# Altium project pca20072.PrjPCB (part 2 of 2)

## Sheet pca20072_sensors.SchDoc: nRF54L15 Tag - Sensors
size A4; Organization: Nordic Semiconductor; DocumentNumber: 4; Revision: 1.0.0; SheetNumber: 4; SheetTotal: 5; Author: RUBR; CompanyName: Nordic Semiconductor; DrawnBy: RUBR; DocumentSize: A4; ProjectName: nRF54L15-TAG
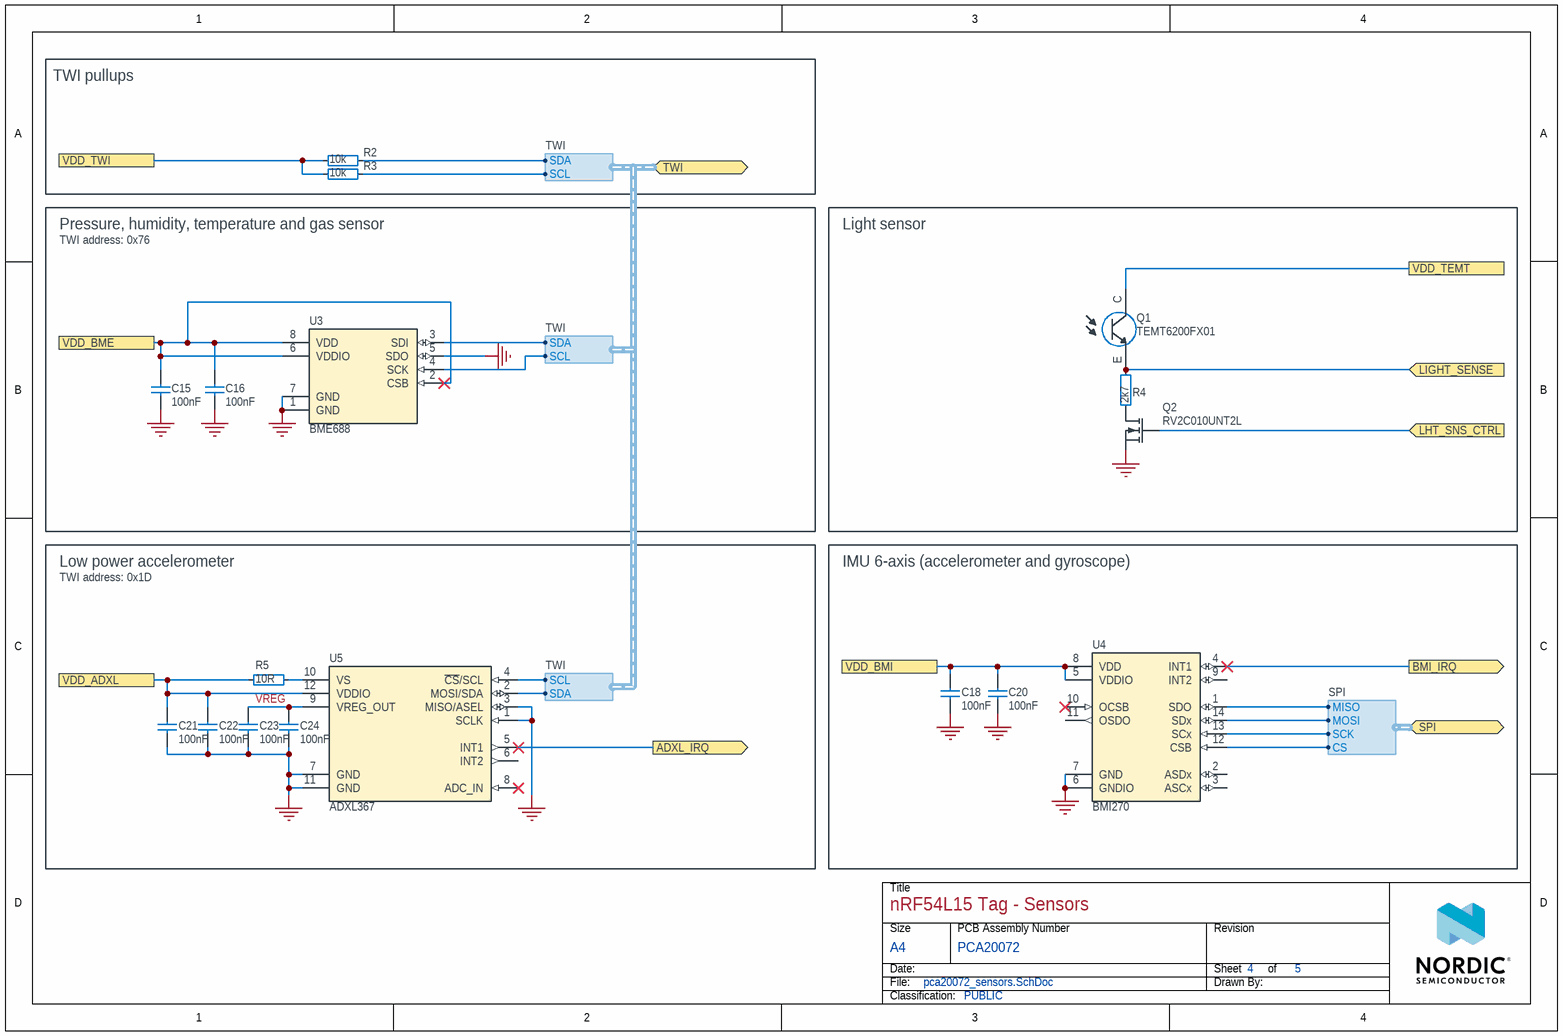
[diagram p3: pca20072_sensors.SchDoc]

### Parts
C15  100nF  [CAPC0603X03L_C]
C16  100nF  [CAPC0603X03L_C]
C18  100nF  [CAPC0603X03L_C]
C20  100nF  [CAPC0603X03L_C]
C21  100nF  [CAPC0603X03L_C]
C22  100nF  [CAPC0603X03L_C]
C23  100nF  [CAPC0603X03L_C]
C24  100nF  [CAPC0603X03L_C]
Q1  TEMT6200FX01  [TEMT6200FX01]
Q2  RV2C010UNT2L  [DFN65P100X40-3L]
R2  10k  [RESC0603X03L_C]
R3  10k  [RESC0603X03L_C]
R4  2k7  [RESC0603X03L_C]
R5  10R  [RESC0603X03L_C]
U3  BME688  [BME680]
U4  BMI270  [BMI270]
U5  ADXL367  [LGA50P220X230X97-12N]

### Blocks framed on the sheet
TWI pullups: R2 R3
Pressure, humidity, temperature and gas sensor: C15 C16 U3
Light sensor: Q1 Q2 R4
Low power accelerometer: C21-C24 R5 U5
IMU 6-axis (accelerometer and gyroscope): C18 C20 U4

### Ports
ADXL_IRQ (out), BMI_IRQ (out), LHT_SNS_CTRL (in), LIGHT_SENSE (in), SPI (bidir, harness SPI), TWI (bidir, harness TWI), VDD_ADXL, VDD_BME, VDD_BMI, VDD_TEMT, VDD_TWI

### Harnesses
TWI: SCL, SDA
SPI: MISO, MOSI, SCK, CS

### Nets
GND: C15.1 C16.1 C18.1 C20.1 C21.1 C22.1 C23.1 C24.1 Q2.2(S) U3.1(GND) U3.5(SDO) U3.7(GND) U4.6(GNDIO) U4.7(GND) U5.1(SCLK) U5.3(MISO/ASEL) U5.7(GND) U5.11(GND)
P0.03: U5.5(INT1) ; port ADXL_IRQ
P1.04: U4.4(INT1) ; port BMI_IRQ
P1.05: U4.1(SDO) ; port SPI.MISO
P1.06: U4.14(SDx) ; port SPI.MOSI
P1.07: U4.12(CSB) ; port SPI.CS
P1.08: U4.13(SCx) ; port SPI.SCK
P1.11: R3.1 U3.4(SCK) U5.4(~{CS}/SCL) ; port TWI.SCL
P1.12: R2.1 U3.3(SDI) U5.2(MOSI/SDA) ; port TWI.SDA
P1.14: Q1.E R4.2 ; port LIGHT_SENSE
P2.06: Q2.1(G) ; port LHT_SNS_CTRL
VDD: C15.2 C16.2 C18.2 C20.2 C21.2 C22.2 Q1.C R2.2 R3.2 R5.1 U3.2(CSB) U3.6(VDDIO) U3.8(VDD) U4.5(VDDIO) U4.8(VDD) U5.12(VDDIO) ; port VDD_BMI, port VDD_ADXL, port VDD_BME, port VDD_TWI, port VDD_TEMT
VREG: C23.2 C24.2 U5.9(VREG_OUT)
NetQ2_3: Q2.3(D) R4.1
NetR5_2: R5.2 U5.10(VS)

Not connected (* = marked no-connect by the designer): U4 2(ASDx) 3(ASCx) 9(INT2) 10(OCSB)* 11(OSDO); U5 6(INT2) 8(ADC_IN)*

### Notes on the sheet
- TWI address: 0x76
- TWI address: 0x1D
- Title
- Size
- Date:
- File:
- A4
- PCB Assembly Number
- Sheet
- Drawn By:
- Revision
- of
- Classification:

### Library data of the parts
C15 C16 C21-C24 = C0201-100n: Capacitor, X5R, ±10%, 100nF, 16V; Manufacturer: N.A.; Part number IPS: 00000001248, 00000002505; Part number Norautron: 262071862; Part number NEMS: 100200078; Component Status: Active; Pad Count: 2; Part Number: C0201-100n; Manufacturer Part Number: N.A.; Footprint Doc: 0201; LatestRevisionDate: 2024-06-27; Published: 2014-11-13; Value: 100nF; Note: 16V; Artikkelnr Noca: N.A.; ComponentLink1URL: N.A.; ComponentLink1Description: Datasheet; ComponentLink2URL: N.A.; ComponentLink2Description: Supplier link; HelpURL: N.A.; Supplier 1: N.A.; Supplier Part Number 1: N.A.; Supplier 2: N.A.; Supplier Part Number 2: N.A.; PartId: 100200078; Component Class: Capacitors; Author: rsk
C18 C20 = C0201-100n: Capacitor, X5R, ±10%, 100nF, 16V; Manufacturer: N.A.; Part number IPS: 00000001248, 00000002505; Part number Norautron: 262071862; Part number NEMS: 100200078; Pad Count: 2; Component Status: Active; Part Number: C0201-100n; Manufacturer Part Number: N.A.; Footprint Doc: 0201; LatestRevisionDate: 2024-06-27; Published: 2014-11-13; Value: 100nF; Note: 16V; Artikkelnr Noca: N.A.; ComponentLink1URL: N.A.; ComponentLink1Description: Datasheet; ComponentLink2URL: N.A.; ComponentLink2Description: Supplier link; HelpURL: N.A.; Supplier 1: N.A.; Supplier Part Number 1: N.A.; Supplier 2: N.A.; Supplier Part Number 2: N.A.; Component Class: Capacitors; PartId: 100200078; Author: rsk
Q1 = TEMT6200FX01: Phototransistors 550nm Top View 0805 (2012 Metric); Manufacturer: Vishay; Part number NEMS: 101400145; Component Status: Active; Pad Count: 2; Note: N.A.; Part Number: TEMT6200FX01; PartId: 101400145; Component Class: Optoelectronics; Author: getr; Manufacturer Part Number: TEMT6200FX01; ComponentLink1URL: https://www.vishay.com/docs/81317/temt6200.pdf; ComponentLink1Description: Datasheet; ComponentLink2URL: https://www.digikey.no/en/products/detail/vishay-semiconductor-opto-division/TEMT6200FX01/1681190?s=N4IgTCBcDaICoFECycBsYAMGBiANDAjAAQgC6AvkA; ComponentLink2Description: Supplier link; HelpURL: https://www.vishay.com/en/product/81317/; LatestRevisionDate: 2023-11-07; Published: 2023-11-07; Footprint Doc: N.A.; Value: TEMT6200FX01; Supplier 1: DigiKey; Supplier Part Number 1: 751-1056-1-ND; Supplier 2: N.A.; Supplier Part Number 2: N.A.; Artikkelnr Noca: N.A.; Part number IPS: N.A.; Part number Norautron: N.A.
Q2 = RV2C010UNT2L: N-Channel MOSFET, 20V, 1A, 470mOhm, 400mW, -55°C ~ 150°C; Manufacturer: Rohm Semiconductor; Part number IPS: 00000009976; Part number Norautron: 26320026; Part number NEMS: 101300132; Component Status: Active; Pad Count: 3; Note: N.A.; Artikkelnr Noca: 35010020; Part Number: RV2C010UNT2L; PartId: 101300132; Component Class: Semiconductors; Author: rsk; Manufacturer Part Number: RV2C010UNT2L; ComponentLink1URL: N.A.; ComponentLink1Description: Datasheet; ComponentLink2URL: N.A.; ComponentLink2Description: Supplier link; HelpURL: http://rohmfs.rohm.com/en/products/databook/datasheet/discrete/transistor/mosfet/rv2c010unt2l-e.pdf; LatestRevisionDate: 2024-09-18; Published: 2016-08-09; Footprint Doc: DFN-3; Value: RV2C010UNT2L; Supplier 1: DigiKey; Supplier Part Number 1: RV2C010UNT2LCT-ND; Supplier 2: Mouser; Supplier Part Number 2: 755-RV2C010UNT2L
R2 R3 = R0201-10k: Resistor, ±1%, 0.05W; Manufacturer: N.A.; Part number IPS: 00000001255; Part number Norautron: 26107101; Part number NEMS: 100100065; Component Status: Active; Pad Count: 2; Note: Chip Res 1%; Part Number: R0201-10k; PartId: 100100065; Component Class: Resistors; Author: rsk; Manufacturer Part Number: N.A.; ComponentLink1URL: N.A.; ComponentLink1Description: Datasheet; ComponentLink2URL: N.A.; ComponentLink2Description: Supplier link; HelpURL: N.A.; LatestRevisionDate: 2014-11-13; Published: 2014-11-13; Footprint Doc: 0201; Value: 10k; Supplier 1: N.A.; Supplier Part Number 1: N.A.; Supplier 2: N.A.; Supplier Part Number 2: N.A.; Artikkelnr Noca: N.A.
R4 = R0201-2k7: Resistor, ±1%, 0.05W; Manufacturer: N.A.; Part number Norautron: 26108481; Part number NEMS: 100100054; Component Status: Active; Pad Count: 2; Note: Chip Res 1%; Part Number: R0201-2k7; PartId: 100100054; Component Class: Resistors; Author: rsk; Manufacturer Part Number: N.A.; ComponentLink1URL: N.A.; ComponentLink1Description: Datasheet; ComponentLink2URL: N.A.; ComponentLink2Description: Supplier link; HelpURL: N.A.; LatestRevisionDate: 2014-11-13; Published: 2014-11-13; Footprint Doc: 0201; Value: 2k7; Supplier 1: N.A.; Supplier Part Number 1: N.A.; Supplier 2: N.A.; Supplier Part Number 2: N.A.; Artikkelnr Noca: N.A.; Part number IPS: N.A.
R5 = R0201-10R: Resistor, ±1%, 0.05W; Manufacturer: N.A.; Part number NEMS: 100100014; Component Status: Active; Pad Count: 2; Note: Chip Res 1%; Part Number: R0201-10R; PartId: 100100014; Component Class: Resistors; Author: rsk; Manufacturer Part Number: N.A.; ComponentLink1URL: N.A.; ComponentLink1Description: Datasheet; ComponentLink2URL: N.A.; ComponentLink2Description: Supplier link; HelpURL: N.A.; LatestRevisionDate: 2014-11-13; Published: 2014-11-13; Footprint Doc: 0201; Value: 10R; Supplier 1: N.A.; Supplier Part Number 1: N.A.; Supplier 2: N.A.; Supplier Part Number 2: N.A.; Artikkelnr Noca: N.A.; Part number IPS: N.A.; Part number Norautron: N.A.
U3 = BME688: Low power gas, pressure, temperature & humidity sensor; Manufacturer: Bosch; Part number NEMS: 101900619; Component Status: Active; Pad Count: 8; Note: N.A.; Part Number: BME688; PartId: 101900619; Component Class: Misc_ICs; Author: rsk; Manufacturer Part Number: BME688; ComponentLink1URL: https://www.bosch-sensortec.com/media/boschsensortec/downloads/datasheets/bst-bme688-ds000.pdf; ComponentLink1Description: Datasheet; ComponentLink2Description: Supplier link; HelpURL: https://www.bosch-sensortec.com/products/environmental-sensors/gas-sensors/bme688/; LatestRevisionDate: 2024-10-03; Published: 2020-07-07; Footprint Doc: LGA-8; Value: BME688; Supplier 1: DigiKey; Supplier Part Number 1: 828-BME688TR-ND; Supplier 2: N.A.; Supplier Part Number 2: N.A.; Artikkelnr Noca: N.A.; Part number IPS: N.A.; Part number Norautron: N.A.
U4 = BMI270: 6-axis, smart, low-power, inertial measurement unit; Manufacturer: Bosch; Part number NEMS: 101900620; Note: N.A.; Pad Count: 14; Component Status: Active; Part Number: BMI270; Manufacturer Part Number: BMI270; ComponentLink1URL: https://www.bosch-sensortec.com/media/boschsensortec/downloads/datasheets/bst-bmi270-ds000.pdf; ComponentLink1Description: Datasheet; ComponentLink2URL: https://www.bosch-sensortec.com/products/motion-sensors/imus/bmi270.html; ComponentLink2Description: Supplier link; HelpURL: https://www.bosch-sensortec.com/media/boschsensortec/downloads/datasheets/bst-bmi270-ds000.pdf; Footprint Doc: LGA-14; LatestRevisionDate: 2021-08-03; Published: 2020-07-07; Value: BMI270; Supplier 1: DigiKey; Supplier Part Number 1: 828-1091-1-ND; Supplier 2: Mouser; Supplier Part Number 2: 262-BMI270; Artikkelnr Noca: N.A.; Part number IPS: N.A.; Component Class: Misc_ICs; PartId: 101900620; Author: rsk; Part number Norautron: N.A.
U5 = ADXL367BCCZ: Micropower, 3-Axis, ±2 g/±4 g/±8 g Digital Output MEMS Accelerometer; Manufacturer: Analog Devices; Part number NEMS: 101900775; Note: N.A.; Component Status: Active; Pad Count: 12; Part Number: ADXL367BCCZ; Manufacturer Part Number: ADXL367BCCZ; ComponentLink1URL: http://www.analog.com/media/en/technical-documentation/data-sheets/ADXL367.pdf; ComponentLink1Description: Datasheet; ComponentLink2URL: https://www.digikey.com/en/products/detail/analog-devices-inc/ADXL367BCCZ-RL7/16360579; ComponentLink2Description: Supplier link; HelpURL: http://www.analog.com/en/products/ADXL367.html; Footprint Doc: LGA-12; LatestRevisionDate: 2023-04-03; Published: 2023-04-03; Value: ADXL367; Supplier 1: DigiKey; Supplier Part Number 1: 505-ADXL367BCCZ-RL7CT-ND; Supplier 2: Mouser; Supplier Part Number 2: 584-ADXL367BCCZ-RL7; Artikkelnr Noca: N.A.; Part number IPS: N.A.; Component Class: Misc_ICs; Author: rubr; Part number Norautron: N.A.; PartId: 101900775

## Sheet pca20072_misc.SchDoc: =BoardTitle+' - Misc'
size A4; Organization: Nordic Semiconductor; DocumentNumber: 5; Revision: 1.0.0; SheetNumber: 5; SheetTotal: 5; Author: RUBR; CompanyName: Nordic Semiconductor; DrawnBy: RUBR; DocumentSize: A4; ProjectName: nRF54L15-TAG
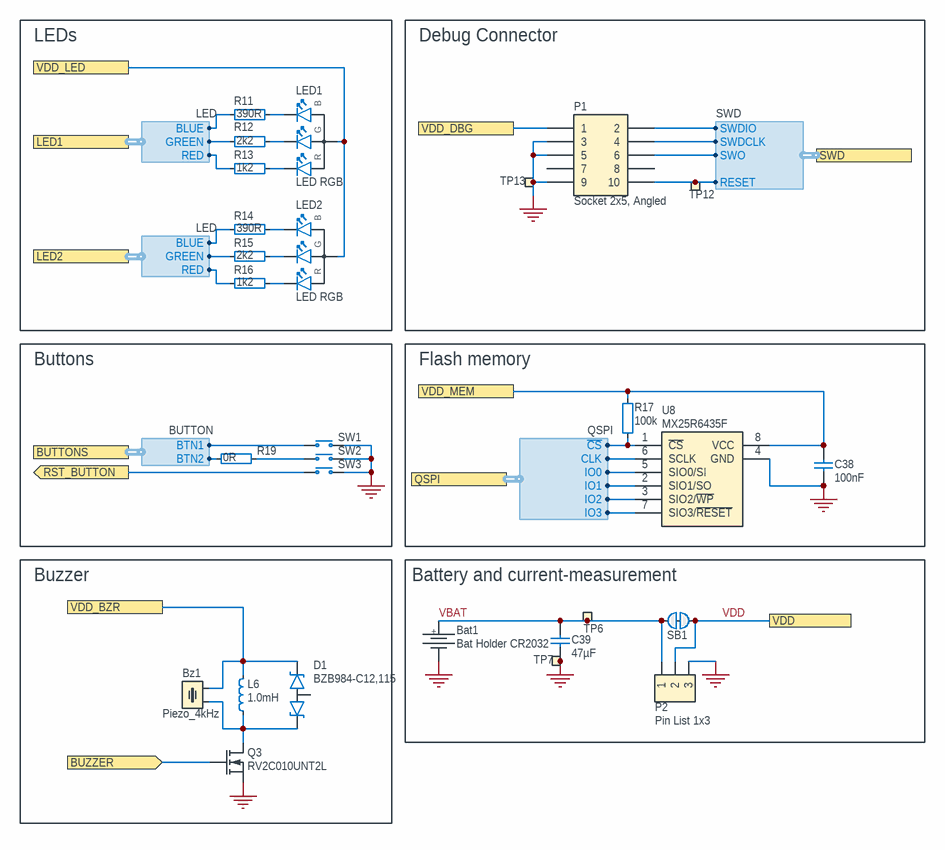
[diagram p4: pca20072_misc.SchDoc]

### Parts
Bat1  Bat Holder CR2032  [L-KLS5-CR2032-23-B1]
Bz1  Piezo_4kHz  [Buzzer_PKMCS0909]
C38  100nF  [CAPC0603X03L_C]
C39  47µF  [CAPC1608X06L]
D1  BZB984-C12,115  [SOTFL50P160X60-3L]
L6  1.0mH  [INDC2520X10N]
LED1  LED RGB  [LED_RGB_0603]
LED2  LED RGB  [LED_RGB_0603]
P1  Socket 2x5, Angled  [SOCKET_ANG_2x5_TH-1.27mm]
P2  Pin List 1x3  [LIST_1x3-NC]
Q3  RV2C010UNT2L  [DFN65P100X40-3L]
R11  390R  [RESC0603X03L_C]
R12  2k2  [RESC0603X03L_C]
R13  1k2  [RESC0603X03L_C]
R14  390R  [RESC0603X03L_C]
R15  2k2  [RESC0603X03L_C]
R16  1k2  [RESC0603X03L_C]
R17  100k  [RESC0603X03L_C]
R19  0R  [RESC0603X03L_C]
SB1  Solderbridge  [Solderbridge_Shorted_Power]  (value not drawn)  (net tie, no BOM)
SW1  PB SW  [KLS-TS3402]  (value not drawn)
SW2  PB SW  [SW_TACTILE_2.6x3.0MM_4-LEAD]  (value not drawn)
SW3  PB SW  [SW_TACTILE_2.6x3.0MM_4-LEAD]  (value not drawn)
TP6  Ø1.5mm,SMD  [TP_SMD_D1.5mm]  (value not drawn)  (no BOM)
TP7  Ø1.5mm,SMD  [TP_SMD_D1.5mm]  (value not drawn)  (no BOM)
TP12  Ø1.0mm,SMD  [TP_SMD_D1.0mm]  (value not drawn)  (no BOM)
TP13  Ø1.0mm,SMD  [TP_SMD_D1.0mm]  (value not drawn)  (no BOM)
U8  MX25R6435F  [SON80P300X60_HS-9N]

### Blocks framed on the sheet
LEDs: LED1 LED2 R11-R16
Debug Connector: P1 TP12 TP13
Buttons: R19 SW1-SW3
Flash memory: C38 R17 U8
Buzzer: Bz1 D1 L6 Q3
Battery and current-measurement: Bat1 C39 P2 SB1 TP6 TP7

### Ports
BUTTONS (harness BUTTON), BUZZER (in), LED1 (harness LED), LED2 (harness LED), QSPI (harness QSPI), RST_BUTTON (out), SWD (harness SWD), VDD, VDD_BZR, VDD_DBG, VDD_LED, VDD_MEM

### Harnesses
QSPI: ~{CS}, IO0, CLK, IO1, IO2, IO3
LED: GREEN, RED, BLUE
SWD: SWDIO, SWDCLK, SWO, RESET
BUTTON: BTN2, BTN1

### Nets
GND: Bat1.2 C38.2 C39.1 P1.3 P1.5 P1.9 P2.3 Q3.2(S) SW1.1(N.O) SW2.2(COM) SW3.1(N.O) TP7.1 TP13.1 U8.4(GND) U8.9(GND)
P0.00: SW1.2(COM) ; port BUTTONS.BTN1
P0.01: R19.2 ; port BUTTONS.BTN2
P0.02: R16.1 ; port LED2.RED
P0.04: R15.1 ; port LED2.GREEN
P1.13: Q3.1(G) ; port BUZZER
P2.00: U8.7(SIO3/~{RESET}) ; port QSPI.IO3
P2.01: U8.6(SCLK) ; port QSPI.CLK
P2.02: U8.5(SIO0/SI) ; port QSPI.IO0
P2.03: U8.3(SIO2/~{WP}) ; port QSPI.IO2
P2.04: U8.2(SIO1/SO) ; port QSPI.IO1
P2.05: R17.1 U8.1(~{CS}) ; port QSPI.~{CS}
P2.07: P1.6 R14.1 ; port SWD.SWO, port LED2.BLUE
P2.08: R13.1 ; port LED1.RED
P2.09: R11.1 ; port LED1.BLUE
P2.10: R12.1 ; port LED1.GREEN
RESET: P1.10 SW3.2(COM) TP12.1 ; port RST_BUTTON, port SWD.RESET
SWDCLK: P1.4 ; port SWD.SWDCLK
SWDIO: P1.2 ; port SWD.SWDIO
VBAT: Bat1.1 C39.2 P2.1 SB1.1 TP6.1
VDD: Bz1.1 C38.1 D1.1(K1) L6.2 LED1.4(A) LED2.4(A) P1.1 P2.2 R17.2 SB1.2 U8.8(VCC) ; port VDD_MEM, port VDD_LED, port VDD_DBG, port VDD_BZR, port VDD
NetBz1_2: Bz1.2 D1.2(K2) L6.1 Q3.3(D)
NetLED1_1: LED1.1(C_RED) R13.2
NetLED1_2: LED1.2(C_GREEN) R12.2
NetLED1_3: LED1.3(C_BLUE) R11.2
NetLED2_1: LED2.1(C_RED) R16.2
NetLED2_2: LED2.2(C_GREEN) R15.2
NetLED2_3: LED2.3(C_BLUE) R14.2
NetR19_1: R19.1 SW2.1(N.O)

Not connected (* = marked no-connect by the designer): D1 3(CA); P1 7 8

### Notes on the sheet
- Title
- Size
- Date:
- File:
- A4
- PCB Assembly Number
- Sheet
- Drawn By:
- Revision
- of
- Classification:
- (in symbol APHF1608LSEEQBDZGKC) B; G; R
- (in symbol Bat Holder L-KLS5-CR2032-23-BR) +

### Library data of the parts
Bat1 = Bat Holder L-KLS5-CR2032-23-BR: Bat Holder CR2032 SMD; Manufacturer: KLS Electronic; Part number NEMS: 100500651; Component Status: Active; Pad Count: 2; Artikkelnr Noca: N.A.; System: Connector; Part Number: Bat Holder L-KLS5-CR2032-23-BR; PartId: 100500651; Component Class: Connectors; Author: rsk; Manufacturer Part Number: L-KLS5-CR2032-23-BR; ComponentLink1URL: http://www.klsele.com/admin/product_upload/20151124103736KLS5-CR2032-23-B.pdf; ComponentLink1Description: Datasheet; ComponentLink2URL: N.A.; ComponentLink2Description: Supplier link; HelpURL: http://www.klsele.com/products/connectors/Coin-Cell-Holders-Series/4685.html; LatestRevisionDate: 2025-09-19; Published: 2019-08-28; Footprint Doc: CR2032_HOLDER; Value: Bat Holder CR2032; Note: Bat Holder CR2032; Supplier 1: Milexia; Supplier Part Number 1: L-KLS5-CR2032-23-BR; Supplier 2: Mouser; Supplier Part Number 2: 614-SMTU2032-LF; Part number IPS: N.A.; Part number Norautron: N.A.
Bz1 = PKMCS0909E4000-R1: Piezo Buzzer, SMD, 9.0mm x 9.0mm x 1.9mm, 4kHz, 65dB @ 1.5V, <12.5Vp-p; Manufacturer: Murata; Part number NEMS: 101000026; Component Status: Active; Pad Count: 2; Note: 1.5 ~ 12.5V; Artikkelnr Noca: N.A.; Part Number: PKMCS0909E4000-R1; PartId: 101000026; Component Class: Transducers; Author: rsk; Manufacturer Part Number: PKMCS0909E4000-R1; ComponentLink1URL: N.A.; ComponentLink1Description: Datasheet; ComponentLink2URL: N.A.; ComponentLink2Description: Supplier link; HelpURL: https://www.murata.com/en-global/products/productdetail.aspx?partno=PKMCS0909E4000-R1; LatestRevisionDate: 2020-08-04; Published: 2020-08-04; Footprint Doc: Buzzer_PKMCS0909; Value: Piezo_4kHz; Supplier 1: DigiKey; Supplier Part Number 1: 490-9647-1-ND; Supplier 2: Mouser; Supplier Part Number 2: 81-PKMCS0909E4000-R1; Part number IPS: N.A.; Part number Norautron: N.A.
C38 = C0201-100n: as C18 on sheet pca20072_sensors; Part Number: C0201-100n; Value: 100nF; Footprint Doc: 0201; Component Class: Capacitors; Author: rsk; PartId: 100200078; Manufacturer Part Number: N.A.; ComponentLink1URL: N.A.; ComponentLink1Description: Datasheet; ComponentLink2URL: N.A.; ComponentLink2Description: Supplier link; HelpURL: N.A.; LatestRevisionDate: 2024-06-27; Published: 2014-11-13; Note: 16V; Supplier 1: N.A.; Supplier Part Number 1: N.A.; Supplier 2: N.A.; Supplier Part Number 2: N.A.; Artikkelnr Noca: N.A.
C39 = C0603-47µ: Capacitor, X5R, ±20%, 6.3V; Manufacturer: N.A.; Part number IPS: 00000001818; Part number NEMS: 100200277; Component Status: Active; Pad Count: 2; Part Number: C0603-47µ; PartId: 100200277; Component Class: Capacitors; Author: rsk; Manufacturer Part Number: N.A.; ComponentLink1URL: N.A.; ComponentLink1Description: Datasheet; ComponentLink2URL: N.A.; ComponentLink2Description: Supplier link; HelpURL: N.A.; LatestRevisionDate: 2020-04-28; Published: 2016-04-16; Footprint Doc: 0603; Value: 47µF; Note: 6.3V; Supplier 1: N.A.; Supplier Part Number 1: N.A.; Supplier 2: N.A.; Supplier Part Number 2: N.A.; Artikkelnr Noca: N.A.; Part number Norautron: N.A.
D1 = BZB984-C12,115: Zener Diode Array, 1 Pair, Common Anode, 12V, 265mW, ±5%; Manufacturer: Nexperia; Part number NEMS: 101300214; Component Status: Active; Pad Count: 3; Note: N.A.; Part Number: BZB984-C12,115; Component Class: Semiconductors; Author: rubr; Manufacturer Part Number: BZB984-C12,115; ComponentLink1URL: https://assets.nexperia.com/documents/data-sheet/BZB984_SER.pdf; ComponentLink1Description: Datasheet; ComponentLink2URL: https://www.digikey.com/en/products/detail/nexperia-usa-inc/BZB984-C12-115/1155439; ComponentLink2Description: Supplier link; HelpURL: https://www.nexperia.com/product/BZB984-C12; LatestRevisionDate: 2025-01-30; Published: 2025-01-30; Footprint Doc: SOT-663; Value: BZB984-C12,115; Supplier 1: DigiKey; Supplier Part Number 1: 1727-1585-1-ND; Supplier 2: N.A.; Supplier Part Number 2: N.A.; Artikkelnr Noca: N.A.; Part number IPS: N.A.; Part number Norautron: N.A.; PartId: 101300214
L6 = L1008-1m0-15mA-24Ω-LSQBA251818T102K: Inductor, 15mA, ±10%, 24Ω; Manufacturer: Taiyo Yuden; Part number NEMS: 100300509; Component Status: Active; Pad Count: 2; Note: -40°C ~ 105°C; Artikkelnr Noca: N.A.; Part Number: L1008-1m0-15mA-24Ω-LSQBA251818T102K; Component Class: Inductors; Author: rubr; Manufacturer Part Number: LSQBA251818T102K; ComponentLink1URL: https://ds.yuden.co.jp/TYCOMPAS/or/specSheet?pn=LSQBA251818T102K; ComponentLink1Description: Datasheet; ComponentLink2URL: https://www.digikey.com/en/products/detail/taiyo-yuden/LSQBA251818T102K/16661924; ComponentLink2Description: Supplier link; HelpURL: https://ds.yuden.co.jp/TYCOMPAS/or/detail?pn=LSQBA251818T102K&u=M; LatestRevisionDate: 2025-01-30; Published: 2025-01-30; Footprint Doc: 1008; Value: 1.0mH; Supplier 1: DigiKey; Supplier Part Number 1: 587-LSQBA251818T102KCT-ND; Supplier 2: N.A.; Supplier Part Number 2: N.A.; Part number IPS: N.A.; Part number Norautron: N.A.; PartId: 100300509
LED1 LED2 = APHF1608LSEEQBDZGKC: RGB LED 1.60 mm x 0.80 mm SMD; Manufacturer: Kingbright Company LLC; Part number IPS: 00000001254; Part number Norautron: 26470023; Part number NEMS: 101400123; Note: N.A.; Pad Count: 4; Component Status: Active; Part Number: APHF1608LSEEQBDZGKC; Manufacturer Part Number: APHF1608LSEEQBDZGKC; LatestRevisionDate: 2017-11-09; Published: 2017-09-18; Value: LED RGB; Artikkelnr Noca: N.A.; Footprint Doc: LED_RGB_0603; ComponentLink1Description: Datasheet; ComponentLink1URL: N.A.; ComponentLink2Description: Supplier link; ComponentLink2URL: N.A.; HelpURL: http://www.kingbrightusa.com/images/catalog/SPEC/APHF1608LSEEQBDZGKC.pdf; Supplier 1: DigiKey; Supplier Part Number 1: 754-2143-1-ND; Supplier 2: N.A.; Supplier Part Number 2: N.A.; PartId: 101400123; Component Class: Optoelectronics; Author: rsk
P1 = Socket 2x5, 1.27mm, Right Angle, TH: Socket 2x5, 1.27mm (50mil), Right Angle, TH; Manufacturer: WCON; Manufacturer Part Number: 2344-205RS0CUNR3; Part number NEMS: 100500894; Note: (Replaced 2344-205RS0CUNR1); Artikkelnr Noca: N.A.; Pad Count: 10; Component Status: Active; System: Connector; Part Number: Socket 2x5, 1.27mm, Right Angle, TH; Footprint Doc: SOCKET_ANG_2x5_TH-1.27mm; LatestRevisionDate: 2025-01-30; Published: 2025-01-30; Value: Socket 2x5, Angled; Part number IPS: N.A.; ComponentLink1URL: https://www.wcon.com/assets/upload/2023-09-09/C_2344-2XXRXXCUNT1.pdf; ComponentLink1Description: Datasheet; ComponentLink2URL: N.A.; ComponentLink2Description: Supplier link; HelpURL: https://www.wcon.com/product/2344-2xxrxxcunx1.html; Supplier 1: Milexia; Supplier Part Number 1: 2344-205RS0CUNR3; Supplier 2: N.A.; Supplier Part Number 2: N.A.; Component Class: Connectors; Author: rubr; Part number Norautron: N.A.; PartId: 100500894
P2 = Pin List 1x3, N.C.: Pin List 1x3, 2.54mm (100mil); Manufacturer: N.A.; Part number NEMS: 100500305; Component Status: Active; Pad Count: 3; Assembly: Not mounted; System: Connector; Part Number: Pin List 1x3, N.C.; PartId: 100500305; Component Class: Connectors; Author: rsk; Manufacturer Part Number: N.A.; ComponentLink1URL: N.A.; ComponentLink1Description: Datasheet; ComponentLink2URL: N.A.; ComponentLink2Description: Supplier link; HelpURL: N.A.; LatestRevisionDate: 2017-09-07; Published: 2017-09-07; Footprint Doc: LIST_1x3; Value: Pin List 1x3; Note: N.A.; Supplier 1: N.A.; Supplier Part Number 1: N.A.; Supplier 2: N.A.; Supplier Part Number 2: N.A.; Artikkelnr Noca: N.A.; Part number IPS: N.A.; Part number Norautron: N.A.
Q3 = RV2C010UNT2L: as Q2 on sheet pca20072_sensors; Part Number: RV2C010UNT2L; PartId: 101300132; Component Class: Semiconductors; Author: rsk; Manufacturer Part Number: RV2C010UNT2L; ComponentLink1URL: N.A.; ComponentLink1Description: Datasheet; ComponentLink2URL: N.A.; ComponentLink2Description: Supplier link; HelpURL: http://rohmfs.rohm.com/en/products/databook/datasheet/discrete/transistor/mosfet/rv2c010unt2l-e.pdf; LatestRevisionDate: 2024-09-18; Published: 2016-08-09; Footprint Doc: DFN-3; Value: RV2C010UNT2L; Supplier 1: DigiKey; Supplier Part Number 1: RV2C010UNT2LCT-ND; Supplier 2: Mouser; Supplier Part Number 2: 755-RV2C010UNT2L
R11 R14 = R0201-390: Resistor, ±1%, 0.05W; Manufacturer: N.A.; Part number IPS: 00000001258; Part number Norautron: 26470031; Part number NEMS: 100100035; Note: Chip Res 1%; Pad Count: 2; Component Status: Active; Part Number: R0201-390; Manufacturer Part Number: N.A.; ComponentLink1URL: N.A.; ComponentLink1Description: Datasheet; ComponentLink2URL: N.A.; ComponentLink2Description: Supplier link; HelpURL: N.A.; Footprint Doc: 0201; LatestRevisionDate: 2014-11-13; Published: 2014-11-13; Value: 390R; Supplier 1: N.A.; Supplier Part Number 1: N.A.; Supplier 2: N.A.; Supplier Part Number 2: N.A.; Artikkelnr Noca: N.A.; PartId: 100100035; Component Class: Resistors; Author: rsk
R12 R15 = R0201-2k2: Resistor, ±1%, 0.05W; Manufacturer: N.A.; Part number IPS: 00000001257; Part number Norautron: 26470030; Part number NEMS: 100100052; Note: Chip Res 1%; Pad Count: 2; Component Status: Active; Part Number: R0201-2k2; Manufacturer Part Number: N.A.; ComponentLink1URL: N.A.; ComponentLink1Description: Datasheet; ComponentLink2URL: N.A.; ComponentLink2Description: Supplier link; HelpURL: N.A.; Footprint Doc: 0201; LatestRevisionDate: 2014-11-13; Published: 2014-11-13; Value: 2k2; Supplier 1: N.A.; Supplier Part Number 1: N.A.; Supplier 2: N.A.; Supplier Part Number 2: N.A.; Artikkelnr Noca: N.A.; PartId: 100100052; Component Class: Resistors; Author: rsk
R13 R16 = R0201-1k2: Resistor, ±1%, 0.05W; Manufacturer: N.A.; Part number IPS: 00000001256; Part number Norautron: 26107084; Part number NEMS: 100100045; Note: Chip Res 1%; Pad Count: 2; Component Status: Active; Part Number: R0201-1k2; Manufacturer Part Number: N.A.; ComponentLink1URL: N.A.; ComponentLink1Description: Datasheet; ComponentLink2URL: N.A.; ComponentLink2Description: Supplier link; HelpURL: N.A.; Footprint Doc: 0201; LatestRevisionDate: 2014-11-13; Published: 2014-11-13; Value: 1k2; Supplier 1: N.A.; Supplier Part Number 1: N.A.; Supplier 2: N.A.; Supplier Part Number 2: N.A.; Artikkelnr Noca: N.A.; PartId: 100100045; Component Class: Resistors; Author: rsk
R17 = R0201-100k: Resistor, ±1%, 0.05W; Manufacturer: N.A.; Part number IPS: 00000001419; Part number Norautron: 26108487; Part number NEMS: 100100080; Note: Chip Res 1%; Pad Count: 2; Component Status: Active; Part Number: R0201-100k; Manufacturer Part Number: N.A.; Footprint Doc: 0201; LatestRevisionDate: 2014-11-13; Published: 2014-11-13; Value: 100k; Artikkelnr Noca: N.A.; ComponentLink1URL: N.A.; ComponentLink1Description: Datasheet; ComponentLink2URL: N.A.; ComponentLink2Description: Supplier link; HelpURL: N.A.; Supplier 1: N.A.; Supplier Part Number 1: N.A.; Supplier 2: N.A.; Supplier Part Number 2: N.A.; Component Class: Resistors; PartId: 100100080; Author: rsk
R19 = R0201-0R: Resistor, ±5%, 0.05W; Manufacturer: N.A.; Part number IPS: 00000003245; Part number NEMS: 100100001; Note: Chip Res 5%; Pad Count: 2; Component Status: Active; Part Number: R0201-0R; Manufacturer Part Number: N.A.; Footprint Doc: 0201; LatestRevisionDate: 2017-11-09; Published: 2014-11-13; Value: 0R; Artikkelnr Noca: N.A.; ComponentLink1URL: N.A.; ComponentLink1Description: Datasheet; ComponentLink2URL: N.A.; ComponentLink2Description: Supplier link; HelpURL: N.A.; Supplier 1: N.A.; Supplier Part Number 1: N.A.; Supplier 2: N.A.; Supplier Part Number 2: N.A.; Component Class: Resistors; PartId: 100100001; Author: rsk; Part number Norautron: N.A.
SB1 = Solderbridge Shorted Power: Shorted Solderbridge Power; Manufacturer: N.A.; Part number NEMS: 100500460; Pad Count: 2; Component Status: Active; System: Connector; Part Number: Solderbridge Shorted Power; PartId: 100500460; Component Class: Connectors; Author: rsk; Manufacturer Part Number: N.A.; ComponentLink1URL: N.A.; ComponentLink1Description: Datasheet; ComponentLink2URL: N.A.; ComponentLink2Description: Supplier link; HelpURL: N.A.; Footprint Doc: Solderbridge_Shorted_Power; LatestRevisionDate: 2012-08-07; Published: 2012-08-07; Value: Solderbridge; Note: N.A.; Supplier 1: N.A.; Supplier Part Number 1: N.A.; Supplier 2: N.A.; Supplier Part Number 2: N.A.; Artikkelnr Noca: N.A.; Part number IPS: N.A.; Part number Norautron: N.A.
SW1 = L-KLS7-TS3402-2.5-250-B-T: Tactile Switch, SPNO, SMD, 260gf, 4.2x3.3x2.5mm; Manufacturer: KLS Electronic; Part number NEMS: 101500152; Note: N.A.; Pad Count: 4; Component Status: Active; Part Number: L-KLS7-TS3402-2.5-250-B-T; Manufacturer Part Number: L-KLS7-TS3402-2.5-250-B-T; LatestRevisionDate: 2026-02-09; Published: 2025-01-23; Value: PB SW; Artikkelnr Noca: N.A.; Footprint Doc: KLS-TS3402; Part number IPS: N.A.; ComponentLink1Description: Datasheet; ComponentLink1URL: https://img.klsele.com/admin/product_upload/20220406093556L-KLS7-TS3402.pdf; ComponentLink2Description: Supplier link; ComponentLink2URL: N.A.; HelpURL: https://www.klsele.com/products/Switches/Tactile-switches/4201.html; Supplier 1: Milexia; Supplier Part Number 1: L-KLS7-TS3402-2.5-250-B-T; Supplier 2: N.A.; Supplier Part Number 2: N.A.; PartId: 101500152; Component Class: Switches; Author: rubr; Part number Norautron: N.A.
SW2 SW3 = KMT021 NGJ LHS: Nano-Miniature Top Actuated Tact Switch with extended life 3.0x2.6mm; Manufacturer: C&K; Part number IPS: 00000005416; Part number NEMS: 101500039; Note: N.A.; Pad Count: 4; Component Status: Active; Part Number: KMT021 NGJ LHS; Manufacturer Part Number: KMT021 NGJ LHS; Footprint Doc: SW_TACTILE_2.6x3.0MM_4-LEAD; LatestRevisionDate: 2013-08-12; Published: 2013-08-12; Value: PB SW; Artikkelnr Noca: N.A.; ComponentLink1URL: N.A.; ComponentLink1Description: Datasheet; ComponentLink2URL: N.A.; ComponentLink2Description: Supplier link; HelpURL: http://media.digikey.com/pdf/Data%20Sheets/C&K/KMT_0xx_NGJ_LHS_Drawing.pdf; Supplier 1: DigiKey; Supplier Part Number 1: CKN10289CT-ND; Supplier 2: Farnell; Supplier Part Number 2: 190-8260; Component Class: Switches; PartId: 101500039; Author: rsk; Part number Norautron: N.A.
TP6 TP7 = TP_SMD_Ø1.5MM: 1.5mm circular SMD testpad; Manufacturer: Nordic Semiconductor; Manufacturer Part Number: N.A.; Part number NEMS: 100500477; Component Status: Active; Pad Count: 1; Part Number: TP_SMD_Ø1.5MM; PartId: 100500477; Component Class: Connectors; Author: rsk; ComponentLink1URL: N.A.; ComponentLink1Description: Datasheet; ComponentLink2URL: N.A.; ComponentLink2Description: Supplier link; HelpURL: N.A.; LatestRevisionDate: 2021-03-05; Published: 2016-06-02; Footprint Doc: TP_SMD_Ø1.5mm; Value: Ø1.5mm,SMD; Note: N.A.; Supplier 1: N.A.; Supplier Part Number 1: N.A.; Supplier 2: N.A.; Supplier Part Number 2: N.A.; Artikkelnr Noca: N.A.; Part number IPS: N.A.; Part number Norautron: N.A.
TP12 TP13 = TP_SMD_Ø1.0MM: 1.0mm circular SMD testpad; Manufacturer: Nordic Semiconductor; Manufacturer Part Number: N.A.; Part number NEMS: 100500475; Component Status: Active; Pad Count: 1; Part Number: TP_SMD_Ø1.0MM; PartId: 100500475; Component Class: Connectors; Author: rsk; ComponentLink1URL: N.A.; ComponentLink1Description: Datasheet; ComponentLink2URL: N.A.; ComponentLink2Description: Supplier link; HelpURL: N.A.; LatestRevisionDate: 2021-03-05; Published: 2013-06-11; Footprint Doc: TP_SMD_Ø1.0mm; Value: Ø1.0mm,SMD; Note: N.A.; Supplier 1: N.A.; Supplier Part Number 1: N.A.; Supplier 2: N.A.; Supplier Part Number 2: N.A.; Artikkelnr Noca: N.A.; Part number IPS: N.A.; Part number Norautron: N.A.
U8 = MX25R6435FZBIH3: Ultra low power, 64M-bit, serial multi I/O flash memory; Manufacturer: Macronix; Part number NEMS: 101900860; Note: N.A.; Pad Count: 8; Component Status: Active; Part Number: MX25R6435FZBIH3; Manufacturer Part Number: MX25R6435FZBIH3; Footprint Doc: USON-8; LatestRevisionDate: 2025-02-11; Published: 2025-02-11; Value: MX25R6435F; Artikkelnr Noca: N.A.; Part number IPS: N.A.; ComponentLink1URL: https://www.macronix.com/Lists/Datasheet/Attachments/8868/MX25R6435F,%20Wide%20Range,%2064Mb,%20v1.6.pdf; ComponentLink1Description: Datasheet; ComponentLink2URL: https://www.digikey.com/en/products/detail/macronix/MX25R6435FZBIH3/21700503; ComponentLink2Description: Supplier link; HelpURL: https://www.macronix.com/en-us/products/NOR-Flash/Serial-NOR-Flash/Pages/spec.aspx?p=MX25R6435F&m=Serial%20NOR%20Flash&n=PM2138&epn=MX25R6435FZBIH3; Supplier 1: DigiKey; Supplier Part Number 1: 1092-MX25R6435FZBIH3CT-ND; Supplier 2: N.A.; Supplier Part Number 2: N.A.; Component Class: Misc_ICs; PartId: 101900860; Author: rubr; Part number Norautron: N.A.

## Nets that join several sheets
GND: pca20072_nrf54l15 (22 pins), pca20072_rffe (12 pins), pca20072_sensors (18 pins), pca20072_misc (15 pins)
P0.00: pca20072_nrf54l15 (U1.23), pca20072_misc (SW1.2)
P0.01: pca20072_nrf54l15 (0.01.1 U1.24), pca20072_misc (R19.2)
P0.02: pca20072_nrf54l15 (0.02.1 U1.27), pca20072_misc (R16.1)
P0.03: pca20072_nrf54l15 (U1.28), pca20072_sensors (U5.5)
P0.04: pca20072_nrf54l15 (0.04.1 U1.29), pca20072_misc (R15.1)
P1.04: pca20072_nrf54l15 (U1.5), pca20072_sensors (U4.4)
P1.05: pca20072_nrf54l15 (U1.6), pca20072_sensors (U4.1)
P1.06: pca20072_nrf54l15 (U1.7), pca20072_sensors (U4.14)
P1.07: pca20072_nrf54l15 (U1.8), pca20072_sensors (U4.12)
P1.08: pca20072_nrf54l15 (U1.9), pca20072_sensors (U4.13)
P1.09: pca20072_nrf54l15 (U1.37), pca20072_rffe (R8.2 U6.1)
P1.10: pca20072_nrf54l15 (U1.38), pca20072_rffe (R9.2 U6.3)
P1.11: pca20072_nrf54l15 (1.11.1 U1.39), pca20072_sensors (R3.1 U3.4 U5.4)
P1.12: pca20072_nrf54l15 (1.12.1 U1.40), pca20072_sensors (R2.1 U3.3 U5.2)
P1.13: pca20072_nrf54l15 (1.13.1 U1.41), pca20072_misc (Q3.1)
P1.14: pca20072_nrf54l15 (1.14.1 U1.42), pca20072_sensors (Q1.E R4.2)
P2.00: pca20072_nrf54l15 (U1.11), pca20072_misc (U8.7)
P2.01: pca20072_nrf54l15 (U1.12), pca20072_misc (U8.6)
P2.02: pca20072_nrf54l15 (U1.13), pca20072_misc (U8.5)
P2.03: pca20072_nrf54l15 (U1.14), pca20072_misc (U8.3)
P2.04: pca20072_nrf54l15 (U1.15), pca20072_misc (U8.2)
P2.05: pca20072_nrf54l15 (2.05.1 U1.16), pca20072_misc (R17.1 U8.1)
P2.06: pca20072_nrf54l15 (2.06.1 U1.17), pca20072_sensors (Q2.1)
P2.07: pca20072_nrf54l15 (2.07.1 U1.18), pca20072_misc (P1.6 R14.1)
P2.08: pca20072_nrf54l15 (U1.19), pca20072_misc (R13.1)
P2.09: pca20072_nrf54l15 (U1.20), pca20072_misc (R11.1)
P2.10: pca20072_nrf54l15 (U1.21), pca20072_misc (R12.1)
RESET: pca20072_nrf54l15 (R1.2 TP3.1), pca20072_misc (P1.10 SW3.2 TP12.1)
RF: pca20072_nrf54l15 (C11.2 L4.2), pca20072_rffe (C28.2)
SWDCLK: pca20072_nrf54l15 (TP4.1 U1.26), pca20072_misc (P1.4)
SWDIO: pca20072_nrf54l15 (TP5.1 U1.25), pca20072_misc (P1.2)
VDD: pca20072_nrf54l15 (12 pins), pca20072_sensors (16 pins), pca20072_misc (11 pins)

## Assembly variants
Full: not fitted C17 C19 C27 C31 P2
Release: not fitted Bz500 C17 C19 C27 C31 C500 D500 L500 LED2 P2 Q300 Q304 Q500 R303 R503 R504 R505 R506 R508 SW501 SW502 U500